# EasyEDA Pro project ProPrj_轮腿机器人-世博同学-正式版.epro, board PCB_IMU_Board
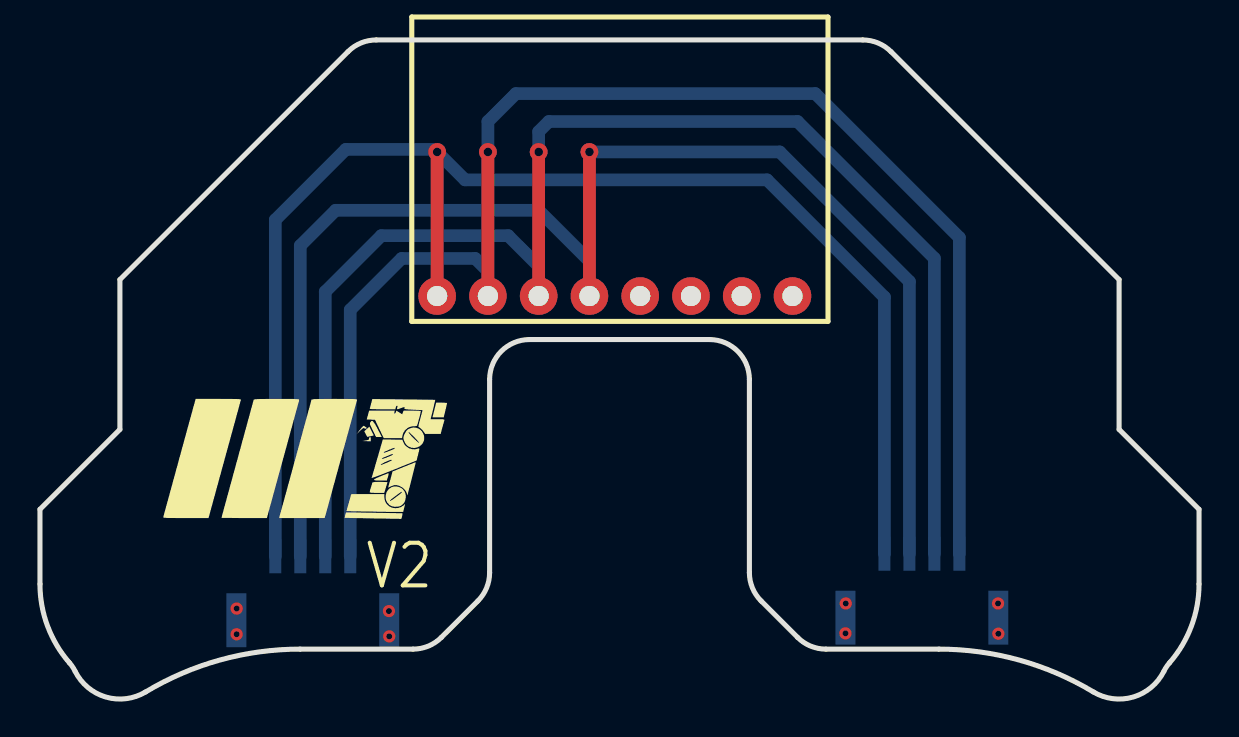
[diagram p3: board, top side]
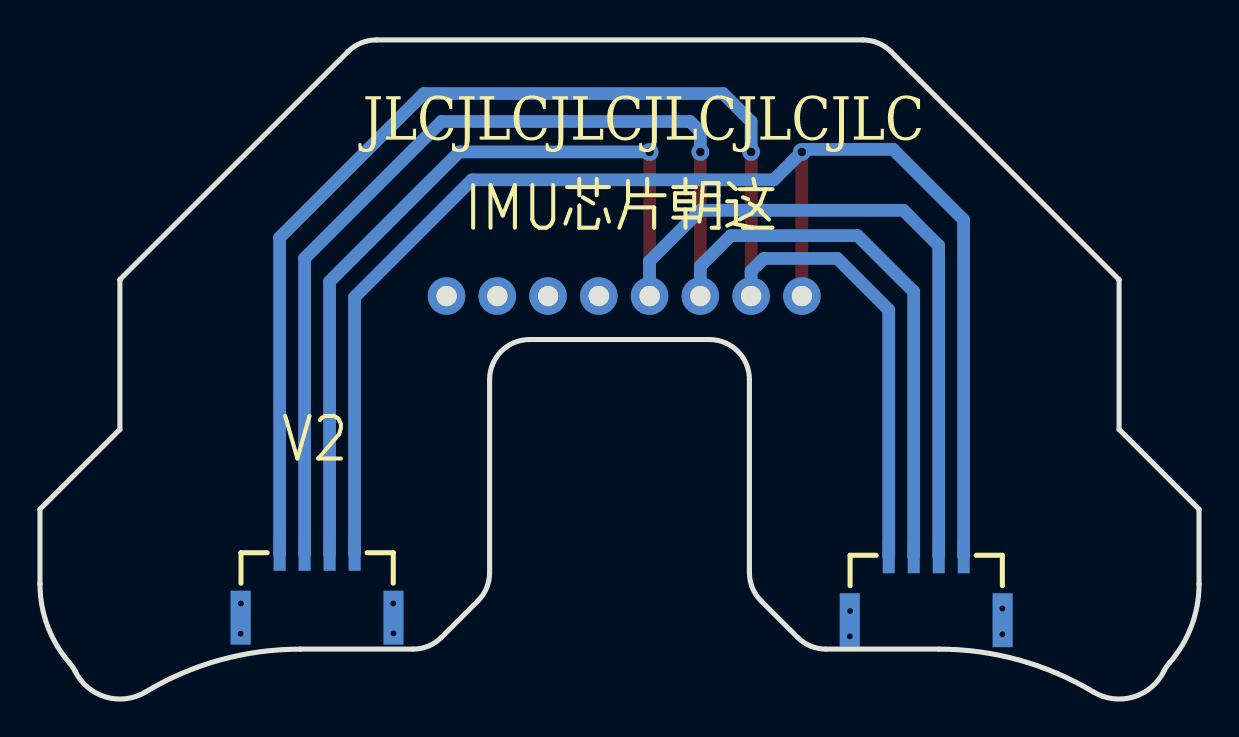
[diagram p4: board, bottom side, seen from below]

Outline 58 x 33 mm; copper layers: Top Layer, Bottom Layer. Coordinates in mm from the lower left corner of the outline.
Outline path: 0,9.5 0,5.76 arc(0.38,3.65) 1.48,1.81 arc(1.63,1.61) 1.76,1.39 arc(3.3,0.1) 5.29,0.36 arc(9,1.95) 13.01,2.5 18.67,2.5 arc(19.44,2.65) 20.09,3.09 21.91,4.91 arc(22.35,5.56) 22.5,6.33 22.5,16 arc(23.09,17.41) 24.5,18 33.5,18 arc(34.91,17.41) 35.5,16 35.5,6.33 arc(35.65,5.56) 36.09,4.91 37.91,3.09 arc(38.56,2.65) 39.33,2.5 44.99,2.5 arc(48.99,1.95) 52.71,0.36 arc(54.7,0.1) 56.24,1.39 arc(56.37,1.61) 56.52,1.81 arc(57.62,3.65) 58,5.76 58,9.5 54,13.5 54,21 42.59,32.41 arc(41.94,32.85) 41.17,33 16.83,33 arc(16.06,32.85) 15.41,32.41 4,21 4,13.5 0,9.5
Stack: Top Layer 0.035mm / Dielectric1 1.51mm FR4 er 4.5 / Bottom Layer 0.035mm

## Design rules (mm)
spacing Default (default): track to track 0.152, other pairs 0 to 0.152
track width Default (default): min 0.254, default 0.254, max 25.4
differential pair differentialPair (default): width min 0.127, default 0.254, max 2.54; gap min 0.152, default 0.152
via Default (default): diameter min 0.61, default 0.61, max 100.025; hole min 0.305, default 0.305, max 59.995

## Placement (name value [footprint] x y rotation side)
J1  GH1.25_4P  [GH1.25_4P_卧贴]  44.13 5.68 180 bottom
J2  GH1.25_4P  [GH1.25_4P_卧贴]  13.65 5.55 180 bottom
P2  -  [MPU6050]  31.31 20.18 0 top

## Footprints (pads in the part's own frame, mm; a bottom-side part is the same pattern mirrored in y, then rotated)
GH1.25_4P_卧贴
  rect 0.6x1.7 smd: 1(-1.875,1.6) 2(-0.625,1.6) 3(0.625,1.6) 4(1.875,1.6)
  rect 1x2.7 smd: 5(3.825,-1.6) 6(-3.825,-1.6)
MPU6050
  round 1.879 hole 1.016: 1(-11.43,0) 2(-8.89,0) 3(-6.35,0) 4(-3.81,0) 5(-1.27,0) 6(1.27,0) 7(3.81,0) 8(6.35,0)

## Nets
GND: J1.1 J2.1 P2.2
VCC: J1.4 J2.4 P2.1
SCL: J1.2 J2.2 P2.3
SDA: J1.3 J2.3 P2.4

Pads without a net: J1 5 6; J2 5 6; P2 5 6 7 8

## Via types
v1: diameter 0.61, hole 0.305, Top Layer to Bottom Layer, 8 vias
v2: diameter 0.889, hole 0.432, Top Layer to Bottom Layer, 4 vias

## Routing (per net, layer and track width the routed paths; a pad name or vN(x,y) marks a point on that pad's centre or on a via; arc(x,y) is an arc through that point)
GND: length 73.5
  Top Layer w0.635: P2.2 v2(22.42,27.39)
  Bottom Layer w0.635: v2(22.42,27.39) 22.42,28.92 23.81,30.31 38.8,30.31 46.01,23.1 J1.1 ; P2.2 22.42,21.42 21.78,22.06 18.1,22.06 15.53,19.49 J2.1
VCC: length 71.9
  Top Layer w0.635: P2.1 v2(19.88,27.39)
  Bottom Layer w0.635: J1.4 42.26,20.12 36.39,26 21.27,26 v2(19.88,27.39) 19.75,27.52 15.3,27.52 11.78,23.99 J2.4
(no net):
  vias: v1(9.84,4.53) v1(9.84,3.24) v1(17.46,4.41) v1(17.48,3.14) v1(40.32,4.79) v1(40.31,3.29) v1(47.94,4.79) v1(47.96,3.27)
SCL: length 73.1
  Top Layer w0.635: P2.3 v2(24.96,27.39)
  Bottom Layer w0.635: J1.2 44.76,22.07 37.91,28.92 25.46,28.92 24.95,28.41 v2(24.95,27.39) ; P2.3 24.95,21.68 23.43,23.2 17.08,23.2 14.28,20.4 J2.2
SDA: length 73.1
  Top Layer w0.635: P2.4 v2(27.5,27.39)
  Bottom Layer w0.635: v2(27.49,27.39) 37.02,27.39 43.51,20.9 J1.3 ; J2.3 13.03,22.7 14.8,24.47 24.95,24.47 27.49,21.93 P2.4

## Text on the board
Bottom Silkscreen Layer: V2 | IMU芯片朝这 | JLCJLCJLCJLCJLCJLC
Top Silkscreen Layer: V2
